# Altium project PCB_Project.PrjPcb (part 3 of 4)

## Sheet Microcontroller.SchDoc
size A4; SheetNumber: 3; SheetTotal: 4
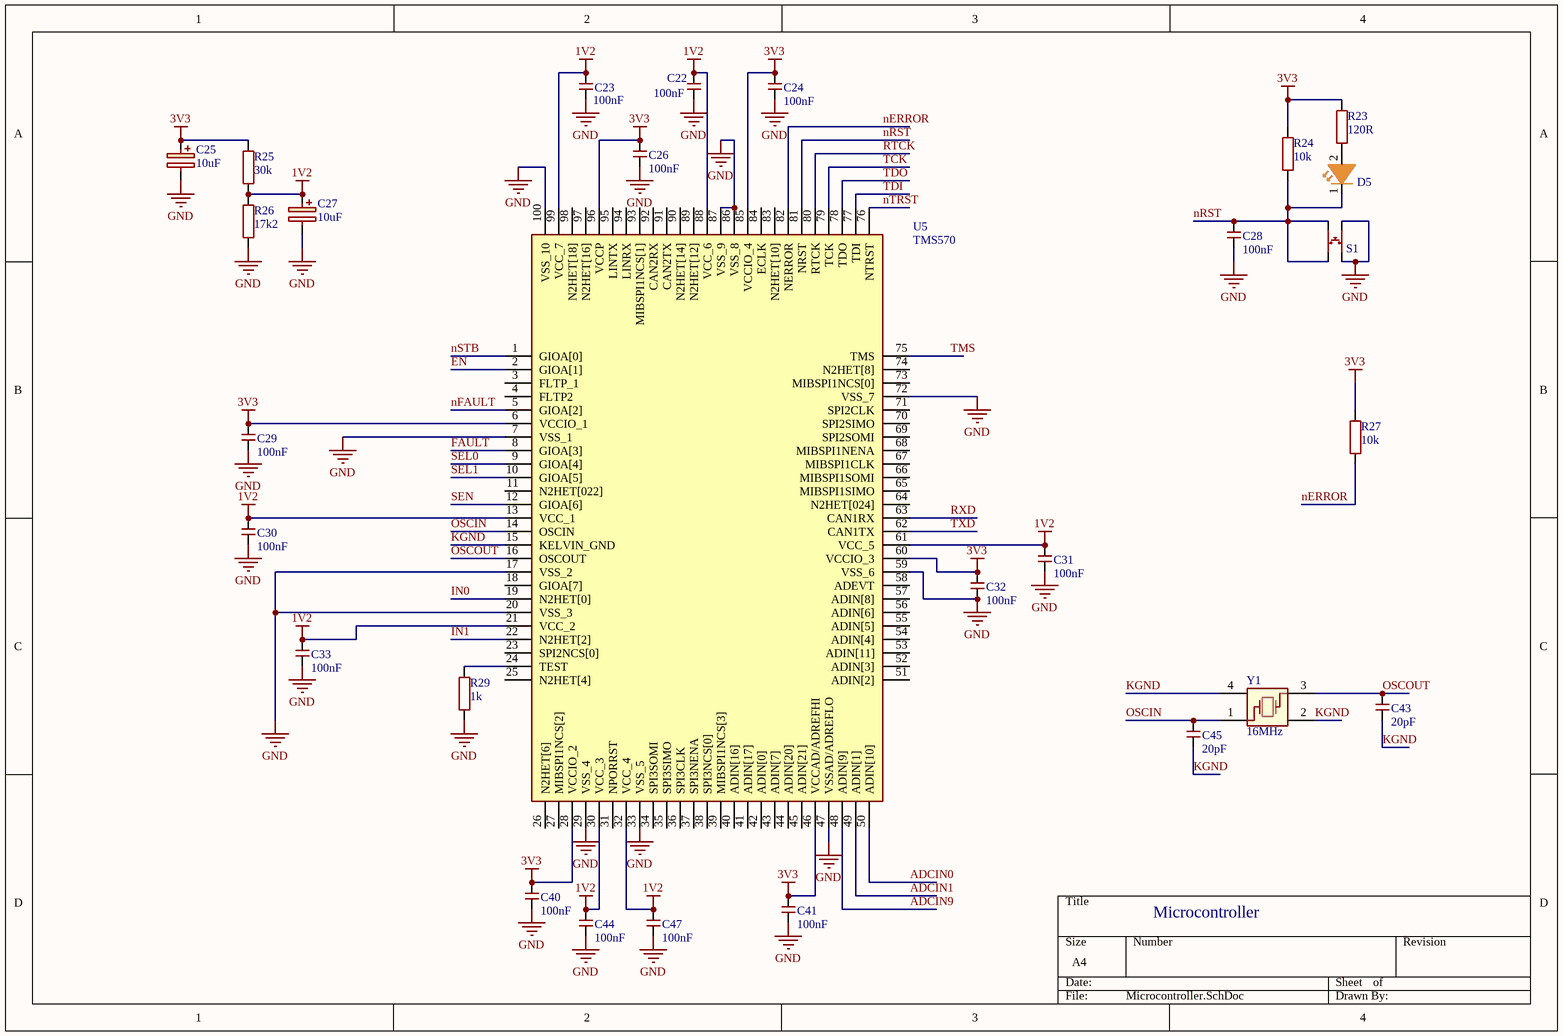
[diagram p2: Microcontroller.SchDoc]

### Parts
C22  100nF  [C0402]
C23  100nF  [C0402]
C24  100nF  [C0402]
C25  10uF  [CAPAE660X565N]
C26  100nF  [C0402]
C27  10uF  [CAPAE660X565N]
C28  100nF  [C0402]
C29  100nF  [C0402]
C30  100nF  [C0402]
C31  100nF  [C0402]
C32  100nF  [C0402]
C33  100nF  [C0402]
C40  100nF  [C0402]
C41  100nF  [C0402]
C43  20pF  [C0402]
C44  100nF  [C0402]
C45  20pF  [C0402]
C47  100nF  [C0402]
D5  150060AS75000  [LED-0603]  (value not drawn)
R23  120R  [R0402]
R24  10k  [R0402]
R25  30k  [R0402]
R26  17k2  [R0402]
R27  10k  [R0402]
R29  1k  [R0402]
S1  Pushbutton  [Pushbutton]  (value not drawn)
U5  TMS570  [QFP50P1600X1600X160-100N]
Y1  16MHz  [ECS1601037B2CTNTR]

### Nets
1V2: C22.2 C23.2 C27.1(+) C30.2 C31.2 C33.2 C44.2 C47.2 R25.1 R26.2 U5.13(VCC_1) U5.21(VCC_2) U5.30(VCC_3) U5.32(VCC_4) U5.61(VCC_5) U5.88(VCC_6) U5.99(VCC_7)
3V3: C24.2 C25.1(+) C26.2 C29.2 C32.2 C40.2 C41.2 R23.2 R24.2 R25.2 R27.2 U5.6(VCCIO_1) U5.28(VCCIO_2) U5.46(VCCAD/ADREFHI) U5.60(VCCIO_3) U5.85(VCCIO_4) U5.96(VCCP)
GND: C22.1 C23.1 C24.1 C25.2 C26.1 C27.2 C28.1 C29.1 C30.1 C31.1 C32.1 C33.1 C40.1 C41.1 C44.1 C47.1 R26.1 R29.1 S1.1 S1.2 U5.7(VSS_1) U5.17(VSS_2) U5.20(VSS_3) U5.29(VSS_4) U5.33(VSS_5) U5.47(VSSAD/ADREFLO) U5.59(VSS_6) U5.72(VSS_7) U5.86(VSS_8) U5.87(VSS_9) U5.100(VSS_10)
ADCIN0: U5.50(ADIN[10])
ADCIN1: U5.49(ADIN[1])
ADCIN9: U5.48(ADIN[9])
EN: U5.2(GIOA[1])
~{FAULT}: U5.8(GIOA[3])
IN0: U5.19(N2HET[0])
IN1: U5.22(N2HET[2])
KGND: C43.1 C45.1 U5.15(KELVIN_GND) Y1.2 Y1.4
nERROR: R27.1 U5.82(NERROR)
nFAULT: U5.5(GIOA[2])
nRST: C28.2 D5.1(K) R24.1 S1.3 S1.4 U5.81(NRST)
nSTB: U5.1(GIOA[0])
nTRST: U5.76(NTRST)
OSCIN: C45.2 U5.14(OSCIN) Y1.1
OSCOUT: C43.2 U5.16(OSCOUT) Y1.3
RTCK: U5.80(RTCK)
RXD: U5.63(CAN1RX)
SEL0: U5.9(GIOA[4])
SEL1: U5.10(GIOA[5])
SEN: U5.12(GIOA[6])
TCK: U5.79(TCK)
TDI: U5.77(TDI)
TDO: U5.78(TDO)
TMS: U5.75(TMS)
TXD: U5.62(CAN1TX)
NetD5_2: D5.2(A) R23.1
NetR29_2: R29.2 U5.24(TEST)

Not connected (* = marked no-connect by the designer): U5 3(FLTP_1) 4(FLTP2) 11(N2HET[022]) 18(GIOA[7]) 23(SPI2NCS[0]) 25(N2HET[4]) 26(N2HET[6]) 27(MIBSPI1NCS[2]) 31(NPORRST) 34(SPI3SOMI) 35(SPI3SIMO) 36(SPI3CLK) 37(SPI3NENA) 38(SPI3NCS[0]) 39(MIBSPI1NCS[3]) 40(ADIN[16]) 41(ADIN[17]) 42(ADIN[0]) 43(ADIN[7]) 44(ADIN[20]) 45(ADIN[21]) 51(ADIN[2]) 52(ADIN[3]) 53(ADIN[11]) 54(ADIN[4]) 55(ADIN[5]) 56(ADIN[6]) 57(ADIN[8]) 58(ADEVT) 64(N2HET[024]) 65(MIBSPI1SIMO) 66(MIBSPI1SOMI) 67(MIBSPI1CLK) 68(MIBSPI1NENA) 69(SPI2SOMI) 70(SPI2SIMO) 71(SPI2CLK) 73(MIBSPI1NCS[0]) 74(N2HET[8]) 83(N2HET[10]) 84(ECLK) 89(N2HET[12]) 90(N2HET[14]) 91(CAN2TX) 92(CAN2RX) 93(MIBSPI1NCS[1]) 94(LINRX) 95(LINTX) 97(N2HET[16]) 98(N2HET[18])

### Notes on the sheet
- Microcontroller

### Library data of the parts
C22-C24 C26 C28-C33 C40 C41 C44 C47 = C0402C104K3PACTU: Ceramic Capacitor, Multilayer, Ceramic, 25V, 10% +Tol, 10% -Tol, X5R, 15% TC, 0.1uF, Surface Mount, 0402; Manufacturer: KEMET; Multilayer: Yes; Supplier: Mouser; Supplier Part Number: 80-C0402C104K3P; Manufacturer Part Number: C0402C104K3PACTU; RoHS: Yes; Category: Ceramic Capacitors; Stock: 262570; Pricing: 1=0.12, 10=0.056, 50=0.056, 100=0.036, 1000=0.026, 10000=0.017 (USD); Mounting Technology: Surface Mount; Pins: 2; Dielectric Material: Ceramic; Package Shape: Rectangular; Case/Package: 0402; Terminal Finish: Nickel; Min Operating Temperature: -55°C; Max Operating Temperature: 85°C; JESD-609 Code: e3; Value: 100nF; Capacitor Type: Ceramic; Tolerance  (fill in as +-): 10%; Packaging: Tape and Reel; Tolerance (fill in as +-): 10%; Rated DC Voltage (URdc): 25V; Temperature Characteristics Code: X5R; Termination: Wraparound; Reach SVHC Compliant: Yes; RoHS Compliant: Yes; ComponentLink1URL: https://datasheet.ciiva.com:443/pdfs/VipMasterIC/IC/KEME/KEME-S-A0008991665/KEME-S-A0008991665-1.pdf?src-supplier=IHS+Markit; ComponentLink1Description: https://datasheet.ciiva.com:443/pdfs/VipMasterIC/IC/KEME/KEME-S-A0008991665/KEME-S-A0008991665-1.pdf?src-supplier=IHS+Markit; ComponentLink2URL: http://www.farnell.com/datasheets/2748284.pdf?src-supplier=Farnell; ComponentLink2Description: http://www.farnell.com/datasheets/2748284.pdf?src-supplier=Farnell; ComponentLink3URL: http://www.farnell.com/datasheets/2748284.pdf?src-supplier=Newark; ComponentLink3Description: http://www.farnell.com/datasheets/2748284.pdf?src-supplier=Newark; ComponentLink4URL: https://datasheet.octopart.com/C0402C104K3PACTU-KEMET-datasheet-181956028.pdf?src-supplier=Element14; ComponentLink4Description: https://datasheet.octopart.com/C0402C104K3PACTU-KEMET-datasheet-181956028.pdf?src-supplier=Element14
C25 C27 = EXV106M050A9GAA: Aluminum Electrolytic Capacitor, Polarized, Aluminum (wet), 50V, 20% +Tol, 20% -Tol, 10uF, Surface Mount, 2626; Manufacturer: KEMET; Dielectric Material: Aluminium; ESR (Equivalent Series Resistance): 2.6R; Leakage Current: 5uA; Ripple Current: 98mA; Tan Delta: 0.12; Supplier: Mouser; Supplier Part Number: 80-EXV106M050A9GAA; Manufacturer Part Number: EXV106M050A9GAA; RoHS: Yes; Category: Aluminum Electrolytic Capacitors; Stock: 17264; Pricing: 1=0.48, 10=0.255, 50=0.255, 100=0.165, 1000=0.139, 10000=0.112 (USD); Mounting Technology: Surface Mount; Pins: 2; Package Shape: Cylindrical; Case/Package: 2626; Min Operating Temperature: -55°C; Max Operating Temperature: 105°C; Polarity: Polarized; Value: 10uF; Capacitor Type: Aluminium; Tolerance  (fill in as +-): 20%; Package Style: SMTMeter; Packaging: Tape and Reel; Tolerance (fill in as +-): 20%; Rated DC Voltage (URdc): 50V; Termination: Flat; Length: 7.8mm; Width: 6.6mm; Height: 5.4mm; Reach SVHC Compliant: Yes; RoHS Compliant: Yes; ComponentLink1URL: https://datasheet.ciiva.com:443/pdfs/VipMasterIC/IC/KEME/KEME-S-A0009591402/KEME-S-A0009591402-1.pdf?src-supplier=IHS+Markit; ComponentLink1Description: https://datasheet.ciiva.com:443/pdfs/VipMasterIC/IC/KEME/KEME-S-A0009591402/KEME-S-A0009591402-1.pdf?src-supplier=IHS+Markit; ComponentLink2URL: https://datasheet.ciiva.com/22698/1500293-22698078.pdf?src-supplier=Element14; ComponentLink2Description: https://datasheet.ciiva.com/22698/1500293-22698078.pdf?src-supplier=Element14
C43 C45 = C0402C200F5GACTU: Ceramic Capacitor, Multilayer, Ceramic, 50V, 1% +Tol, 1% -Tol, C0G, 30ppm/Cel TC, 0.00002uF, Surface Mount, 0402; Manufacturer: KEMET; Multilayer: Yes; Supplier: Mouser; Supplier Part Number: 80-C0402C200F5GACTU; Manufacturer Part Number: C0402C200F5GACTU; RoHS: Yes; Category: Ceramic Capacitors; Stock: 12657; Pricing: 1=1.33, 10=0.87, 50=0.87, 100=0.549, 1000=0.477, 10000=0.408 (USD); Pins: 2; Dielectric Material: Ceramic; Case/Package: 0402; Terminal Finish: Nickel; Min Operating Temperature: -55°C; Max Operating Temperature: 125°C; JESD-609 Code: e3; Value: 20pF; Capacitor Type: Ceramic; Tolerance  (fill in as +-): 1%; Package Style: SMTMeter; Packaging: Tape and Reel; Tolerance (fill in as +-): 1%; Rated DC Voltage (URdc): 50V; Temperature Characteristics Code: C0G; Length: 1mm; Width: 0.5mm; Height: 0.5mm; Reach SVHC Compliant: Yes; RoHS Compliant: Yes; ComponentLink1URL: https://datasheet.ciiva.com:443/pdfs/VipMasterIC/IC/KEME/KEME-S-A0005605168/KEME-S-A0005605168-1.pdf?src-supplier=IHS+Markit; ComponentLink1Description: https://datasheet.ciiva.com:443/pdfs/VipMasterIC/IC/KEME/KEME-S-A0005605168/KEME-S-A0005605168-1.pdf?src-supplier=IHS+Markit; ComponentLink2URL: https://datasheet.octopart.com/C0402C200F5GACTU-KEMET-datasheet-149534727.pdf?src-supplier=Farnell; ComponentLink2Description: https://datasheet.octopart.com/C0402C200F5GACTU-KEMET-datasheet-149534727.pdf?src-supplier=Farnell
D5 = 150060AS75000: Single Color LED, Amber, Water Clear, 1.1mm; Manufacturer: Wurth Electronics; Supplier: Digikey; Supplier Part Number: 732-150060AS75000CT-ND; Manufacturer Part Number: 150060AS75000; RoHS: Yes; Category: LEDs; Stock: 19678; Pricing: 1=0.15, 50=0.142, 100=0.122, 500=0.105 (USD); Optoelectronic Device Type: SINGLE COLOR LED; Reach SVHC Compliant: Yes; RoHS Compliant: Yes; ComponentLink1URL: https://datasheet.ciiva.com:443/pdfs/VipMasterIC/IC/MIDC/MIDC-S-A0007768872/MIDC-S-A0007768872-1.pdf?src-supplier=IHS+Markit; ComponentLink1Description: https://datasheet.ciiva.com:443/pdfs/VipMasterIC/IC/MIDC/MIDC-S-A0007768872/MIDC-S-A0007768872-1.pdf?src-supplier=IHS+Markit; ComponentLink2URL: http://www.farnell.com/datasheets/2621639.pdf?src-supplier=Farnell; ComponentLink2Description: http://www.farnell.com/datasheets/2621639.pdf?src-supplier=Farnell; ComponentLink3URL: http://www.farnell.com/datasheets/2621639.pdf?src-supplier=Element14; ComponentLink3Description: http://www.farnell.com/datasheets/2621639.pdf?src-supplier=Element14; ComponentLink4URL: http://www.farnell.com/datasheets/2621639.pdf?src-supplier=Newark; ComponentLink4Description: http://www.farnell.com/datasheets/2621639.pdf?src-supplier=Newark
R23 = AC0402FR-7D120RL: Fixed Resistor, Metal Glaze/thick Film, 0.0625W, 120ohm, 50V, 1% +/-Tol, -100,100ppm/Cel, 0402; Manufacturer: Yageo; Power: 62.5mW; Package Height: 0.32mm; Package Length: 1mm; Package Width: 0.5mm; Reference Standard: AEC-Q200; Supplier: Mouser; Supplier Part Number: 603-AC0402FR-7D120RL; Manufacturer Part Number: AC0402FR-7D120RL; RoHS: Yes; Category: Chip SMD Resistors; Stock: 13078; Pricing: 1=0.14, 10=0.014, 50=0.014, 100=0.009, 1000=0.008, 10000=0.004 (USD); Pins: 2; Case/Package: 0402; Terminal Finish: Nickel; Min Operating Temperature: -55°C; Max Operating Temperature: 155°C; Tolerance: 1%; JESD-609 Code: e3; Resistor Type: FIXED RESISTOR; Construction: Chip; Packaging: Tape and Reel; Value: 120R; Series: AC; Technology: METAL GLAZE/THICK FILM; Working Voltage: 50V; Temperature Coefficient (ppm/Cel): -100,100; Reach SVHC Compliant: Yes; RoHS Compliant: Yes; ComponentLink1URL: https://datasheet.ciiva.com:443/pdfs/VipMasterIC/IC/YAGO/YAGOS02581/YAGOS02581-1.pdf?src-supplier=IHS+Markit; ComponentLink1Description: https://datasheet.ciiva.com:443/pdfs/VipMasterIC/IC/YAGO/YAGOS02581/YAGOS02581-1.pdf?src-supplier=IHS+Markit
R24 R27 = RP0402BRD0710KL: Resistor, 10K, 0.1%, 0.063W, THIN FILM, 0402;; Manufacturer: Yageo; Supplier: Mouser; Supplier Part Number: 603-RP0402BRD0710KL; Manufacturer Part Number: RP0402BRD0710KL; RoHS: No; Category: Chip SMD Resistors; Stock: 21771; Pricing: 1=0.24, 10=0.171, 50=0.134, 100=0.12, 1000=0.092, 10000=0.074 (USD); ComponentLink1URL: https://datasheet.octopart.com/RP0402BRD0710KL-Yageo-datasheet-179178423.pdf?src-supplier=Newark; ComponentLink1Description: https://datasheet.octopart.com/RP0402BRD0710KL-Yageo-datasheet-179178423.pdf?src-supplier=Newark
R25 = RC0402FR-1330KL: Fixed Resistor, Metal Glaze/thick Film, 0.0625W, 30000ohm, 50V, 1% +/-Tol, 100ppm/Cel, Surface Mount, 0402; Manufacturer: Yageo; Additional Feature: LASER TRIMMABLE; Power: 62.5mW; Rated Temperature: 70°C; Value: 30kR; Temperature Coefficient (ppm/Cel): 100; Package Height: 0.35mm; Package Length: 1mm; Package Width: 0.5mm; Supplier: Mouser; Supplier Part Number: 603-RC0402FR-1330KL; Manufacturer Part Number: RC0402FR-1330KL; RoHS: Yes; Category: Chip SMD Resistors; Stock: 104196; Pricing: 1=0.1, 10=0.01, 50=0.01, 100=0.007, 1000=0.006, 10000=0.003 (USD); Mounting Technology: Surface Mount; Pins: 2; Package Shape: Rectangular; Case/Package: 0402; Terminal Finish: Nickel; Min Operating Temperature: -55°C; Max Operating Temperature: 155°C; Tolerance: 1%; JESD-609 Code: e3; Resistor Type: FIXED RESISTOR; Construction: Chip; Packaging: Tape and Reel; Technology: METAL GLAZE/THICK FILM; Termination: Wraparound; Working Voltage: 50V; Reach SVHC Compliant: Yes; RoHS Compliant: Yes; ComponentLink1URL: https://datasheet.ciiva.com:443/pdfs/VipMasterIC/IC/YAGO/YAGO-S-A0008145938/YAGO-S-A0008145938-1.pdf?src-supplier=IHS+Markit; ComponentLink1Description: https://datasheet.ciiva.com:443/pdfs/VipMasterIC/IC/YAGO/YAGO-S-A0008145938/YAGO-S-A0008145938-1.pdf?src-supplier=IHS+Markit; ComponentLink2URL: https://datasheet.ciiva.com/8889/pyu-rc0402-51-rohs-l-6-8889740.pdf?src-supplier=Avnet; ComponentLink2Description: https://datasheet.ciiva.com/8889/pyu-rc0402-51-rohs-l-6-8889740.pdf?src-supplier=Avnet
R26 = TNPW040217K2BEED: Fixed Resistor, Thin Film, 0.063W, 17200ohm, 50V, 0.1% +/-Tol, 25ppm/Cel, Surface Mount, 0402; Manufacturer: Vishay Dale; Manufacturer Series: TNPW; Power: 63mW; Rated Temperature: 70°C; Value: 17.2kR; Temperature Coefficient (ppm/Cel): 25; Supplier: Mouser; Supplier Part Number: 71-TNPW040217K2BEED; Manufacturer Part Number: TNPW040217K2BEED; RoHS: Yes; Category: Chip SMD Resistors; Stock: 8185; Pricing: 1=0.23, 10=0.192, 50=0.169, 100=0.159, 1000=0.134, 10000=0.113 (USD); Mounting Technology: Surface Mount; Pins: 2; Package Shape: Rectangular; Case/Package: 0402; Terminal Finish: Tin; Min Operating Temperature: -55°C; Max Operating Temperature: 125°C; Tolerance: 0.1%; JESD-609 Code: e3; Resistor Type: FIXED RESISTOR; Packaging: Tape and Reel; Technology: THIN FILM; Termination: Wraparound; Working Voltage: 50V; Reach SVHC Compliant: Yes; RoHS Compliant: Yes; ComponentLink1URL: https://datasheet.ciiva.com:443/pdfs/VipMasterIC/IC/DALE/DALES05753/DALES05753-1.pdf?src-supplier=IHS+Markit; ComponentLink1Description: https://datasheet.ciiva.com:443/pdfs/VipMasterIC/IC/DALE/DALES05753/DALES05753-1.pdf?src-supplier=IHS+Markit; ComponentLink2URL: http://www.vishay.com/docs/28758/tnpw_e3.pdf?src-supplier=Avnet; ComponentLink2Description: http://www.vishay.com/docs/28758/tnpw_e3.pdf?src-supplier=Avnet; ComponentLink3URL: http://www.vishay.com/docs/28758/tnpw_e3.pdf?src-supplier=Digikey; ComponentLink3Description: http://www.vishay.com/docs/28758/tnpw_e3.pdf?src-supplier=Digikey; ComponentLink4URL: http://www.vishay.com/docs/49252/_dbr_smd_resistor_product_overview_vmn_sg2189_1705.pdf?src-supplier=Digikey; ComponentLink4Description: http://www.vishay.com/docs/49252/_dbr_smd_resistor_product_overview_vmn_sg2189_1705.pdf?src-supplier=Digikey
R29 = RT0402FRE101KL: Fixed Resistor, Thin Film, 0.0625W, 1000ohm, 50V, 1% +/-Tol, 50ppm/Cel, Surface Mount, 0402; Manufacturer: Yageo; Supplier: Mouser; Supplier Part Number: 603-RT0402FRE101KL; Manufacturer Part Number: RT0402FRE101KL; RoHS: Yes; Category: Chip SMD Resistors; Stock: 2470; Pricing: 1=0.1, 10=0.026, 50=0.026, 100=0.02, 1000=0.015, 10000=0.01 (USD); Reach SVHC Compliant: Yes; RoHS Compliant: Yes
S1 = Pushbutton: BUTON MINI 6X6X5, 4 PINI; Supplier: Sigmanortec; Price: 0.36 RON
U5 = TMS5700332BPZQQ1: RISC Microcontroller, 32-Bit, FLASH, CORTEX-R4F CPU, 80MHz, CMOS, PQFP100; Manufacturer: Texas Instruments; Supplier: Mouser; Supplier Part Number: 595-TMS5700332BPZQQ1; Manufacturer Part Number: TMS5700332BPZQQ1; RoHS: Yes; Category: Microcontrollers; Stock: 411; Pricing: 1=12.28, 10=9.98, 50=9.52, 100=8.26, 1000=7.2, 10000=6.27 (USD); Terminal Finish: Nickel; JESD-609 Code: e4; Moisture Sensitivity Level: 3; Technology: CMOS; Reach SVHC Compliant: Yes; RoHS Compliant: Yes; ComponentLink1URL: https://www.ti.com:443/lit/ds/symlink/tms570ls0332.pdf?src-supplier=IHS+Markit; ComponentLink1Description: https://www.ti.com:443/lit/ds/symlink/tms570ls0332.pdf?src-supplier=IHS+Markit; ComponentLink2URL: https://www.ti.com/lit/ds/symlink/tms570ls0332.pdf?src-supplier=Digikey; ComponentLink2Description: https://www.ti.com/lit/ds/symlink/tms570ls0332.pdf?src-supplier=Digikey; ComponentLink3URL: http://www.ti.com/lit/gpn/tms570ls0332?src-supplier=Mouser; ComponentLink3Description: http://www.ti.com/lit/gpn/tms570ls0332?src-supplier=Mouser; ComponentLink4URL: http://www.ti.com/general/docs/lit/getliterature.tsp?genericPartNumber=TMS570LS0332&&fileType=pdf&src-supplier=Avnet; ComponentLink4Description: http://www.ti.com/general/docs/lit/getliterature.tsp?genericPartNumber=TMS570LS0332&&fileType=pdf&src-supplier=Avnet
Y1 = ECS-160-10-37B2-CTN-TR: Crystal 16MHz 10pF 4-Pin SMD ECX-1637B2 T/R; Manufacturer: ECS International; Supplier: Mouser; Supplier Part Number: 520-160-10-37B2CTNTR; Manufacturer Part Number: ECS-160-10-37B2-CTN-TR; RoHS: No; Stock: 8732; Pricing: 1=0.28, 10=0.238, 50=0.238, 100=0.232, 1000=0.213, 10000=0.169 (USD); ComponentLink1URL: https://datasheet.octopart.com/ECS-160-10-37B2-CTN-TR-ECS-International-datasheet-163707945.pdf?src-supplier=Master+Electronics; ComponentLink1Description: https://datasheet.octopart.com/ECS-160-10-37B2-CTN-TR-ECS-International-datasheet-163707945.pdf?src-supplier=Master+Electronics

## Sheet Pump Driver.SchDoc
size A4; SheetNumber: 4; SheetTotal: 4
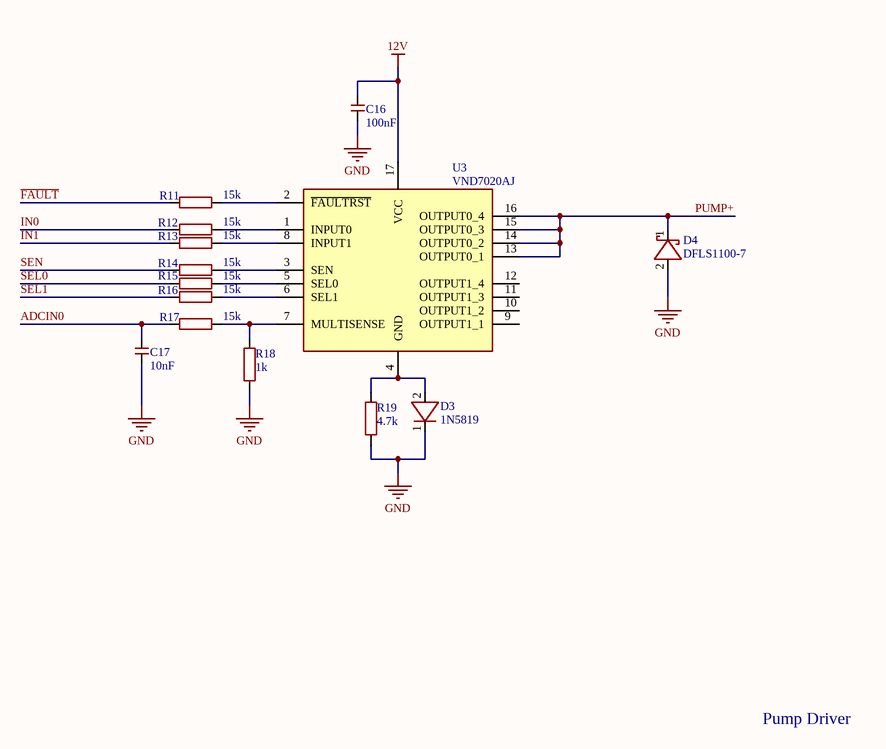
[diagram p3: Pump Driver.SchDoc]

### Parts
C16  100nF  [C0402]
C17  10nF  [C0402]
D3  1N5819  [SOD3716X125N]
D4  DFLS1100-7  [DFLS110]
R11  15k  [R0402]
R12  15k  [R0402]
R13  15k  [R0402]
R14  15k  [R0402]
R15  15k  [R0402]
R16  15k  [R0402]
R17  15k  [R0402]
R18  1k  [R0402]
R19  4.7k  [R0402]
U3  VND7020AJ  [SOP50P600X170-17N]

### Nets
12V: C16.2 U3.17(VCC)
GND: C16.1 C17.1 D3.1(K) D4.2(A) R18.1 R19.1
ADCIN0: C17.2 R17.1
~{FAULT}: R11.1
IN0: R12.1
IN1: R13.1
PUMP+: D4.1(K) U3.13(OUTPUT0_1) U3.14(OUTPUT0_2) U3.15(OUTPUT0_3) U3.16(OUTPUT0_4)
SEL0: R15.1
SEL1: R16.1
SEN: R14.1
NetD3_2: D3.2(A) R19.2 U3.4(GND)
NetR11_2: R11.2 U3.2(~{FAULTRST})
NetR12_2: R12.2 U3.1(INPUT0)
NetR13_2: R13.2 U3.8(INPUT1)
NetR14_2: R14.2 U3.3(SEN)
NetR15_2: R15.2 U3.5(SEL0)
NetR16_2: R16.2 U3.6(SEL1)
NetR17_2: R17.2 R18.2 U3.7(MULTISENSE)

Not connected (* = marked no-connect by the designer): U3 9(OUTPUT1_1) 10(OUTPUT1_2) 11(OUTPUT1_3) 12(OUTPUT1_4)

### Notes on the sheet
- Pump Driver

### Library data of the parts
C16 = C0402C104K3PACTU: as C22 on sheet Microcontroller; Supplier: Mouser; Supplier Part Number: 80-C0402C104K3P; Manufacturer Part Number: C0402C104K3PACTU; RoHS: Yes; Category: Ceramic Capacitors; Stock: 262570; Pricing: 1=0.12, 10=0.056, 50=0.056, 100=0.036, 1000=0.026, 10000=0.017 (USD); Mounting Technology: Surface Mount; Pins: 2; Dielectric Material: Ceramic; Package Shape: Rectangular; Case/Package: 0402; Terminal Finish: Nickel; Min Operating Temperature: -55°C; Max Operating Temperature: 85°C; JESD-609 Code: e3; Value: 100nF; Capacitor Type: Ceramic; Tolerance  (fill in as +-): 10%; Packaging: Tape and Reel; Tolerance (fill in as +-): 10%; Rated DC Voltage (URdc): 25V; Temperature Characteristics Code: X5R; Termination: Wraparound; Reach SVHC Compliant: Yes; RoHS Compliant: Yes; ComponentLink1URL: https://datasheet.ciiva.com:443/pdfs/VipMasterIC/IC/KEME/KEME-S-A0008991665/KEME-S-A0008991665-1.pdf?src-supplier=IHS+Markit; ComponentLink1Description: https://datasheet.ciiva.com:443/pdfs/VipMasterIC/IC/KEME/KEME-S-A0008991665/KEME-S-A0008991665-1.pdf?src-supplier=IHS+Markit; ComponentLink2URL: http://www.farnell.com/datasheets/2748284.pdf?src-supplier=Farnell; ComponentLink2Description: http://www.farnell.com/datasheets/2748284.pdf?src-supplier=Farnell; ComponentLink3URL: http://www.farnell.com/datasheets/2748284.pdf?src-supplier=Newark; ComponentLink3Description: http://www.farnell.com/datasheets/2748284.pdf?src-supplier=Newark; ComponentLink4URL: https://datasheet.octopart.com/C0402C104K3PACTU-KEMET-datasheet-181956028.pdf?src-supplier=Element14; ComponentLink4Description: https://datasheet.octopart.com/C0402C104K3PACTU-KEMET-datasheet-181956028.pdf?src-supplier=Element14
C17 = C0402T103K4RALTU: Ceramic Capacitor, Multilayer, Ceramic, 16V, 10% +Tol, 10% -Tol, X7R, 15% TC, 0.01uF, Surface Mount, 0402; Manufacturer: KEMET; Multilayer: Yes; Supplier: Mouser; Supplier Part Number: 80-C0402T103K4RALTU; Manufacturer Part Number: C0402T103K4RALTU; RoHS: No; Category: Ceramic Capacitors; Stock: 17779; Pricing: 1=0.58, 10=0.42, 50=0.42, 100=0.337, 1000=0.294, 10000=0.246 (USD); Mounting Technology: Surface Mount; Pins: 2; Dielectric Material: Ceramic; Package Shape: Rectangular; Case/Package: 0402; Terminal Finish: Nickel; Min Operating Temperature: -55°C; Max Operating Temperature: 125°C; JESD-609 Code: e0; Value: 10nF; Capacitor Type: Ceramic; Tolerance  (fill in as +-): 10%; Package Style: SMTMeter; Packaging: Tape and Reel; Tolerance (fill in as +-): 10%; Rated DC Voltage (URdc): 16V; Temperature Characteristics Code: X7R; Termination: Wraparound; Length: 1mm; Width: 0.5mm; Height: 0.5mm; RoHS Compliant: No; Reach SVHC Compliant: No; ComponentLink1URL: https://datasheet.ciiva.com:443/pdfs/VipMasterIC/IC/KEME/KEME-S-A0008487487/KEME-S-A0008487487-1.pdf?src-supplier=IHS+Markit; ComponentLink1Description: https://datasheet.ciiva.com:443/pdfs/VipMasterIC/IC/KEME/KEME-S-A0008487487/KEME-S-A0008487487-1.pdf?src-supplier=IHS+Markit; ComponentLink2URL: https://datasheet.ciiva.com/15379/kem-c1027-x7r-cots-smd-15379193.pdf?src-supplier=Mouser; ComponentLink2Description: https://datasheet.ciiva.com/15379/kem-c1027-x7r-cots-smd-15379193.pdf?src-supplier=Mouser; ComponentLink3URL: https://datasheet.ciiva.com/148/kem-c1027-x7r-cots-smd-148853.pdf?src-supplier=Digikey; ComponentLink3Description: https://datasheet.ciiva.com/148/kem-c1027-x7r-cots-smd-148853.pdf?src-supplier=Digikey; ComponentLink4URL: https://datasheet.ciiva.com/148/kem-c1027-x7r-cots-smd-148851.pdf?src-supplier=Digikey; ComponentLink4Description: https://datasheet.ciiva.com/148/kem-c1027-x7r-cots-smd-148851.pdf?src-supplier=Digikey; ComponentLink5URL: https://datasheet.ciiva.com/148/kem-c1027-x7r-cots-smd-148852.pdf?src-supplier=Digikey; ComponentLink5Description: https://datasheet.ciiva.com/148/kem-c1027-x7r-cots-smd-148852.pdf?src-supplier=Digikey
D3 = 1N5819HW-7-F: Rectifier Diode, Schottky, 1 Phase, 1 Element, 1A, 40V V(RRM), Silicon; Manufacturer: Diodes; Package Body Material: Plastic; Number of Elements: 1; Max Power Dissipation: 450mW; Forward Voltage: 320mV; Non-rep Pk Forward Current-Max: 25A; Time @ Peak Reflow Temperature-Max (s): 40s; Qualification Status: Not Qualified; Supplier: Mouser; Supplier Part Number: 621-1N5819HW-F; Manufacturer Part Number: 1N5819HW-7-F; RoHS: Yes; Category: Schottky Diodes; Stock: 170615; Pricing: 1=0.25, 10=0.168, 50=0.168, 100=0.121, 1000=0.091, 10000=0.05 (USD); Pins: 2; Diode Element Material: SILICON; Package Shape: Rectangular; Terminal Finish: Tin; Min Operating Temperature: -65°C; Max Operating Temperature: 125°C; Diode Type: RECTIFIER; JESD-30 Code: R-PDSO-G2; Max Output current: 1A; Package Style: SMALL OUTLINEMeter; Rep Pk Reverse Voltage-Max: 40V; Surface Mount: Yes; Technology: SCHOTTKY; Terminal Form: Gull Wing; Terminal Position: DUAL; JESD-609 Code: e3; Moisture Sensitivity Level: 1; Peak Reflow Temperature (Cel): 260°C; Reach SVHC Compliant: Yes; RoHS Compliant: Yes; ComponentLink1URL: https://datasheet.ciiva.com:443/pdfs/VipMasterIC/IC/DIOD/DIOD-S-A0009689747/DIOD-S-A0009691035-1.pdf?src-supplier=IHS+Markit; ComponentLink1Description: https://datasheet.ciiva.com:443/pdfs/VipMasterIC/IC/DIOD/DIOD-S-A0009689747/DIOD-S-A0009691035-1.pdf?src-supplier=IHS+Markit; ComponentLink2URL: https://datasheet.ciiva.com/27092/1538419-27092484.pdf?src-supplier=Jameco; ComponentLink2Description: https://datasheet.ciiva.com/27092/1538419-27092484.pdf?src-supplier=Jameco; ComponentLink3URL: https://datasheet.ciiva.com/16303/ds30217-16303296.pdf?src-supplier=Future+Electronics; ComponentLink3Description: https://datasheet.ciiva.com/16303/ds30217-16303296.pdf?src-supplier=Future+Electronics; ComponentLink4URL: https://datasheet.ciiva.com/1177/ds30217-1177089.pdf?src-supplier=Element14; ComponentLink4Description: https://datasheet.ciiva.com/1177/ds30217-1177089.pdf?src-supplier=Element14; ComponentLink5URL: https://datasheet.ciiva.com/8303/ds30217-8303132.pdf?src-supplier=Avnet; ComponentLink5Description: https://datasheet.ciiva.com/8303/ds30217-8303132.pdf?src-supplier=Avnet; ComponentLink6URL: https://datasheet.ciiva.com/912/ds30217-912802.pdf?src-supplier=Digikey; ComponentLink6Description: https://datasheet.ciiva.com/912/ds30217-912802.pdf?src-supplier=Digikey; ComponentLink7URL: https://datasheet.ciiva.com/912/ds30217-912803.pdf?src-supplier=Digikey; ComponentLink7Description: https://datasheet.ciiva.com/912/ds30217-912803.pdf?src-supplier=Digikey; ComponentLink8URL: https://datasheet.ciiva.com/912/ds30217-912801.pdf?src-supplier=Digikey; ComponentLink8Description: https://datasheet.ciiva.com/912/ds30217-912801.pdf?src-supplier=Digikey
D4 = DFLS1100-7: Rectifier Diode, Schottky, 1 Phase, 1 Element, 1A, 100V V(RRM), Silicon; Manufacturer: Diodes; Package Body Material: Plastic; Case Connection: CATHODE; Forward Voltage: 770mV; Non-rep Pk Forward Current-Max: 40A; Number of Elements: 1; Time @ Peak Reflow Temperature-Max (s): 40s; Qualification Status: Not Qualified; Supplier: Digikey; Supplier Part Number: DFLS1100DICT-ND; Manufacturer Part Number: DFLS1100-7; RoHS: Yes; Category: Rectifier Diodes; Stock: 32532; Pricing: 1=0.4, 10=0.34, 100=0.2363, 500=0.18452, 1000=0.14998 (USD); Pins: 2; Diode Element Material: SILICON; Package Shape: Rectangular; Terminal Finish: Tin; Min Operating Temperature: -55°C; Max Operating Temperature: 175°C; JESD-609 Code: e3; Diode Type: RECTIFIER; JESD-30 Code: R-PDSO-F2; Moisture Sensitivity Level: 1; Max Output current: 1A; Package Style: SMALL OUTLINEMeter; Peak Reflow Temperature (Cel): 260°C; Rep Pk Reverse Voltage-Max: 100V; Surface Mount: Yes; Technology: SCHOTTKY; Terminal Form: Flat; Terminal Position: DUAL; RoHS Compliant: Yes; Reach SVHC Compliant: No; ComponentLink1URL: https://datasheet.ciiva.com:443/pdfs/VipMasterIC/IC/DIOD/DIOD-S-A0001756819/DIOD-S-A0001756819-1.pdf?src-supplier=IHS+Markit; ComponentLink1Description: https://datasheet.ciiva.com:443/pdfs/VipMasterIC/IC/DIOD/DIOD-S-A0001756819/DIOD-S-A0001756819-1.pdf?src-supplier=IHS+Markit; ComponentLink2URL: https://datasheet.ciiva.com/4715/ds30497-81105-4715653.pdf?src-supplier=Mouser; ComponentLink2Description: https://datasheet.ciiva.com/4715/ds30497-81105-4715653.pdf?src-supplier=Mouser; ComponentLink3URL: https://datasheet.ciiva.com/6932/ds30497-6932064.pdf?src-supplier=Newark; ComponentLink3Description: https://datasheet.ciiva.com/6932/ds30497-6932064.pdf?src-supplier=Newark; ComponentLink4URL: https://datasheet.ciiva.com/4245/2460ds30497-4245287.pdf?src-supplier=Arrow+Electronics; ComponentLink4Description: https://datasheet.ciiva.com/4245/2460ds30497-4245287.pdf?src-supplier=Arrow+Electronics; ComponentLink5URL: https://datasheet.ciiva.com/22695/1915475-22695803.pdf?src-supplier=Element14; ComponentLink5Description: https://datasheet.ciiva.com/22695/1915475-22695803.pdf?src-supplier=Element14; ComponentLink6URL: https://datasheet.ciiva.com/7964/ds30497-7964246.pdf?src-supplier=Element14; ComponentLink6Description: https://datasheet.ciiva.com/7964/ds30497-7964246.pdf?src-supplier=Element14; ComponentLink7URL: https://datasheet.ciiva.com/914/ds30497-914548.pdf?src-supplier=Digikey; ComponentLink7Description: https://datasheet.ciiva.com/914/ds30497-914548.pdf?src-supplier=Digikey; ComponentLink8URL: https://datasheet.ciiva.com/914/ds30497-914549.pdf?src-supplier=Digikey; ComponentLink8Description: https://datasheet.ciiva.com/914/ds30497-914549.pdf?src-supplier=Digikey; ComponentLink9URL: https://datasheet.ciiva.com/914/ds30497-914550.pdf?src-supplier=Digikey; ComponentLink9Description: https://datasheet.ciiva.com/914/ds30497-914550.pdf?src-supplier=Digikey
R11-R17 = AC0402JR-7W15KL: Chip Resistor Automotive Grade Thick Film 0402 15kOhm 5% Paper T/R; Manufacturer: Yageo; Supplier: Mouser; Supplier Part Number: 603-AC0402JR-7W15KL; Manufacturer Part Number: AC0402JR-7W15KL; RoHS: No; Category: Chip SMD Resistors; Stock: 9990; Pricing: 1=0.15, 10=0.015, 50=0.015, 100=0.01, 1000=0.008, 10000=0.003 (USD)
R18 = RT0402FRE101KL: as R29 on sheet Microcontroller; Supplier: Mouser; Supplier Part Number: 603-RT0402FRE101KL; Manufacturer Part Number: RT0402FRE101KL; RoHS: Yes; Category: Chip SMD Resistors; Stock: 2470; Pricing: 1=0.1, 10=0.026, 50=0.026, 100=0.02, 1000=0.015, 10000=0.01 (USD); Reach SVHC Compliant: Yes; RoHS Compliant: Yes
R19 = RC0402FR-7W4K7L: Fixed Resistor, Metal Glaze/thick Film, 0.125W, 4700ohm, 50V, 1% +/-Tol, 200ppm/Cel, Surface Mount, 0402; Manufacturer: Yageo; Additional Feature: LASER TRIMMABLE; Power: 125mW; Rated Temperature: 70°C; Value: 4.7kR; Temperature Coefficient (ppm/Cel): 200; Package Height: 0.35mm; Package Length: 1mm; Package Width: 0.5mm; Supplier: Mouser; Supplier Part Number: 603-RC0402FR-7W4K7L; Manufacturer Part Number: RC0402FR-7W4K7L; RoHS: Yes; Category: Chip SMD Resistors; Stock: 9262; Pricing: 1=0.15, 10=0.015, 50=0.015, 100=0.01, 1000=0.008, 10000=0.003 (USD); Mounting Technology: Surface Mount; Pins: 2; Package Shape: Rectangular; Case/Package: 0402; Terminal Finish: Nickel; Min Operating Temperature: -55°C; Max Operating Temperature: 155°C; Tolerance: 1%; JESD-609 Code: e3; Resistor Type: FIXED RESISTOR; Construction: Chip; Packaging: Tape and Reel; Technology: METAL GLAZE/THICK FILM; Termination: Wraparound; Working Voltage: 50V; Reach SVHC Compliant: Yes; RoHS Compliant: Yes; ComponentLink1URL: https://datasheet.ciiva.com:443/pdfs/VipMasterIC/IC/YAGO/YAGO-S-A0008145938/YAGO-S-A0008145938-1.pdf?src-supplier=IHS+Markit; ComponentLink1Description: https://datasheet.ciiva.com:443/pdfs/VipMasterIC/IC/YAGO/YAGO-S-A0008145938/YAGO-S-A0008145938-1.pdf?src-supplier=IHS+Markit
U3 = VND7020AJTR: Buffer/Inverter Based Peripheral Driver, PDSO16; Manufacturer: STMicroelectronics; Package Body Material: Plastic; Built-in Protections: Over Current,Over Voltage,Under Voltage,TRANSIENT,THERMAL; Interface IC Type: BUFFER OR INVERTER BASED PERIPHERAL DRIVER; Channels: 1; Output Current Flow Direction: SINK; Max Supply Voltage: 28V; Min Supply Voltage: 4V; Nominal Supply Voltage: 13V; Turn-Off Delay Time: 100us; Turn-On Delay Time: 120us; Supplier: Mouser; Supplier Part Number: 511-VND7020AJTR; Manufacturer Part Number: VND7020AJTR; RoHS: Yes; Category: Power Management ICs; Stock: 132353; Pricing: 1=2.79, 10=2.05, 50=1.93, 100=1.77, 1000=1.53, 10000=1.41 (USD); Case/Package: HLSSOP; Pins: 16; Package Shape: Rectangular; Min Operating Temperature: -40°C; Max Operating Temperature: 125°C; JESD-30 Code: R-PDSO-G16; Package Style: SMALL OUTLINE, HEAT SINK/SLUG, LOW PROFILE, SHRINK PITCHMeter; Surface Mount: Yes; Terminal Form: Gull Wing; Terminal Position: DUAL; Length: 4.9mm; Width: 3.9mm; Height - Seated (Max): 1.7mm; Terminal Pitch: 0.5mm; Reach SVHC Compliant: Yes; RoHS Compliant: Yes; Temperature Grade: AUTOMOTIVE; ComponentLink1URL: https://datasheet.ciiva.com:443/pdfs/VipMasterIC/IC/SGST/SGST-S-A0003587758/SGST-S-A0003587758-1.pdf?src-supplier=IHS+Markit; ComponentLink1Description: https://datasheet.ciiva.com:443/pdfs/VipMasterIC/IC/SGST/SGST-S-A0003587758/SGST-S-A0003587758-1.pdf?src-supplier=IHS+Markit; ComponentLink2URL: http://www.st.com/content/ccc/resource/technical/document/datasheet/53/f9/e8/69/7d/b8/4a/10/DM00157075.pdf/files/DM00157075.pdf/jcr:content/translations/en.DM00157075.pdf?src-supplier=Digikey; ComponentLink2Description: http://www.st.com/content/ccc/resource/technical/document/datasheet/53/f9/e8/69/7d/b8/4a/10/DM00157075.pdf/files/DM00157075.pdf/jcr:content/translations/en.DM00157075.pdf?src-supplier=Digikey; ComponentLink3URL: http://www.st.com/st-web-ui/static/active/en/resource/technical/document/datasheet/DM00157075.pdf?src-supplier=Avnet; ComponentLink3Description: http://www.st.com/st-web-ui/static/active/en/resource/technical/document/datasheet/DM00157075.pdf?src-supplier=Avnet; ComponentLink4URL: https://datasheet.octopart.com/VND7020AJTR-STMicroelectronics-datasheet-42731139.pdf?src-supplier=Future+Electronics; ComponentLink4Description: https://datasheet.octopart.com/VND7020AJTR-STMicroelectronics-datasheet-42731139.pdf?src-supplier=Future+Electronics; ComponentLink5URL: https://datasheet.octopart.com/VND7020AJTR-STMicroelectronics-datasheet-158447462.pdf?src-supplier=SHENGYU+ELECTRONICS; ComponentLink5Description: https://datasheet.octopart.com/VND7020AJTR-STMicroelectronics-datasheet-158447462.pdf?src-supplier=SHENGYU+ELECTRONICS; ComponentLink6URL: https://datasheet.octopart.com/VND7020AJTR-STMicroelectronics-datasheet-140368810.pdf?src-supplier=TME; ComponentLink6Description: https://datasheet.octopart.com/VND7020AJTR-STMicroelectronics-datasheet-140368810.pdf?src-supplier=TME